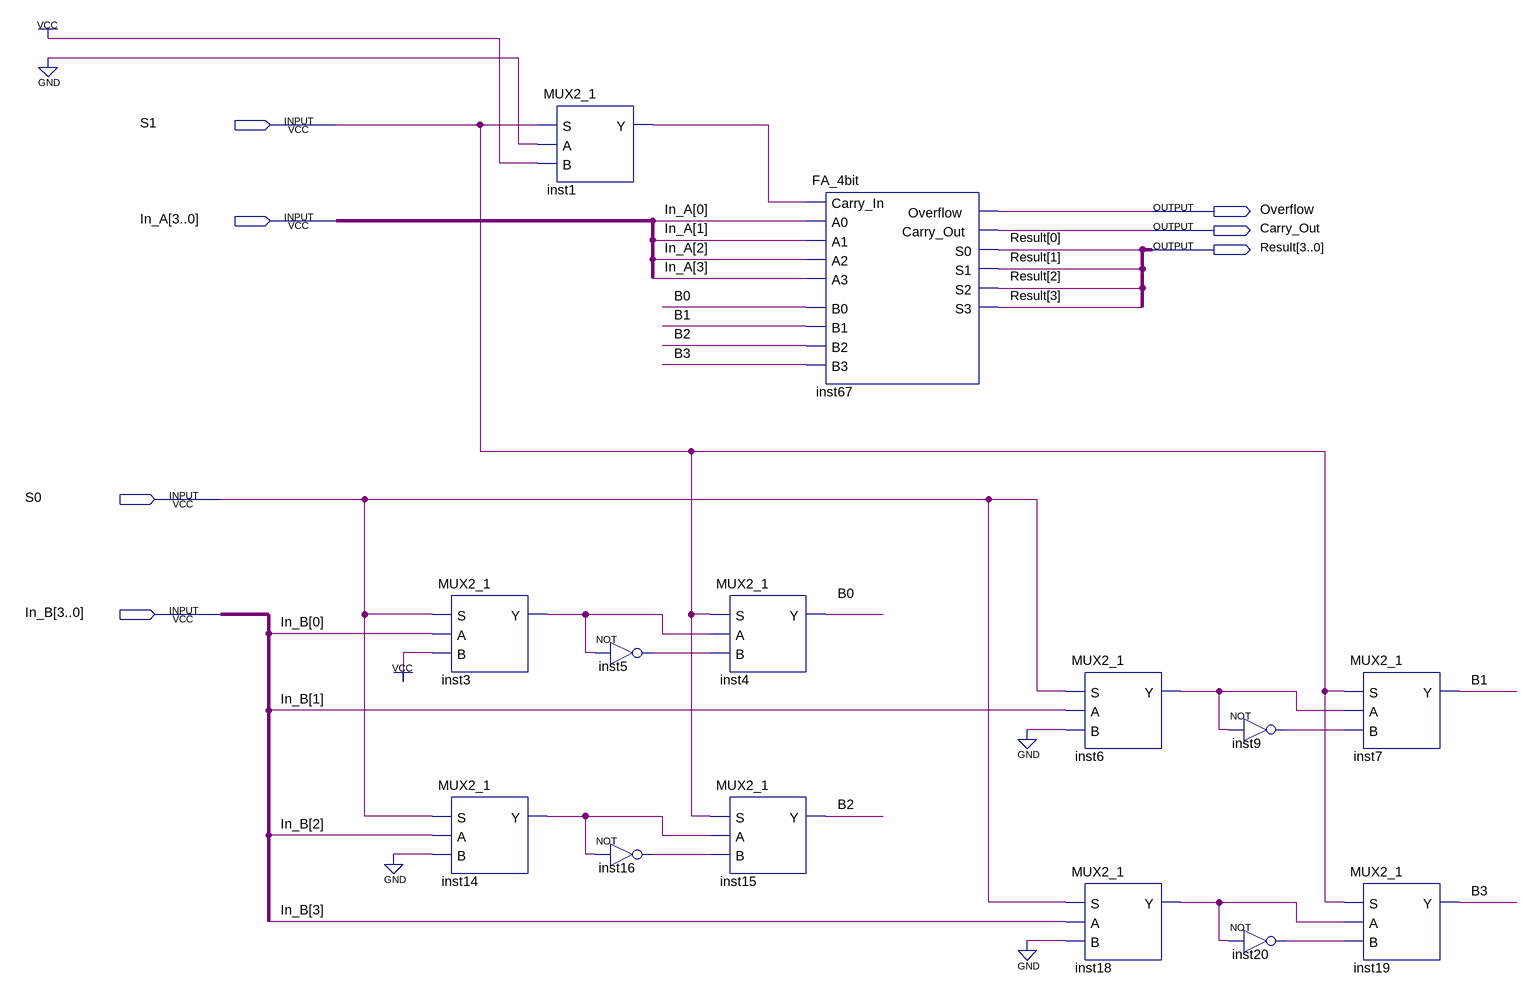
[diagram p0: schematic sheet]
// Quartus schematic AU.bdf as structural Verilog: 14 symbols, 7 pins
module AU (
  input  S1,
  input  [3:0] In_A,
  input  S0,
  input  [3:0] In_B,
  output Overflow,
  output Carry_Out,
  output [3:0] Result
);

  wire B0, B1, B2, B3, inst1_y, inst3_y, inst5_out, inst6_y, inst9_out, inst14_y, inst16_out, inst18_y,
       inst20_out;

  MUX2_1 inst3 (.S(S0), .A(In_B[0]), .B(1'b1), .Y(inst3_y));
  MUX2_1 inst14 (.S(S0), .A(In_B[2]), .B(1'b0), .Y(inst14_y));
  MUX2_1 inst1 (.S(S1), .A(1'b0), .B(1'b1), .Y(inst1_y));
  not inst5 (inst5_out, inst3_y);
  not inst16 (inst16_out, inst14_y);
  MUX2_1 inst4 (.S(S1), .A(inst3_y), .B(inst5_out), .Y(B0));
  MUX2_1 inst15 (.S(S1), .A(inst14_y), .B(inst16_out), .Y(B2));
  FA_4bit inst67 (
    .A0(In_A[0]), .B0(B0), .B1(B1), .A1(In_A[1]), .B2(B2), .A2(In_A[2]), .B3(B3), .A3(In_A[3]),
    .Carry_In(inst1_y), .Overflow(Overflow), .Carry_Out(Carry_Out), .S0(Result[0]), .S1(Result[1]),
    .S2(Result[2]), .S3(Result[3]));
  MUX2_1 inst6 (.S(S0), .A(In_B[1]), .B(1'b0), .Y(inst6_y));
  MUX2_1 inst18 (.S(S0), .A(In_B[3]), .B(1'b0), .Y(inst18_y));
  not inst9 (inst9_out, inst6_y);
  not inst20 (inst20_out, inst18_y);
  MUX2_1 inst7 (.S(S1), .A(inst6_y), .B(inst9_out), .Y(B1));
  MUX2_1 inst19 (.S(S1), .A(inst18_y), .B(inst20_out), .Y(B3));
endmodule
